# EasyEDA Pro project laterscreen.eprj, schematic Schematic1

## Sheets
1 mcu: Board Name: Board1; Create Date: 2025-05-13; Page Name: mcu; Project Name: laterscreen; Schematic Name: Schematic1; Update Date: 2025-05-16; Company: 嘉立创EDA; Page Size: A4; Version: V1.0
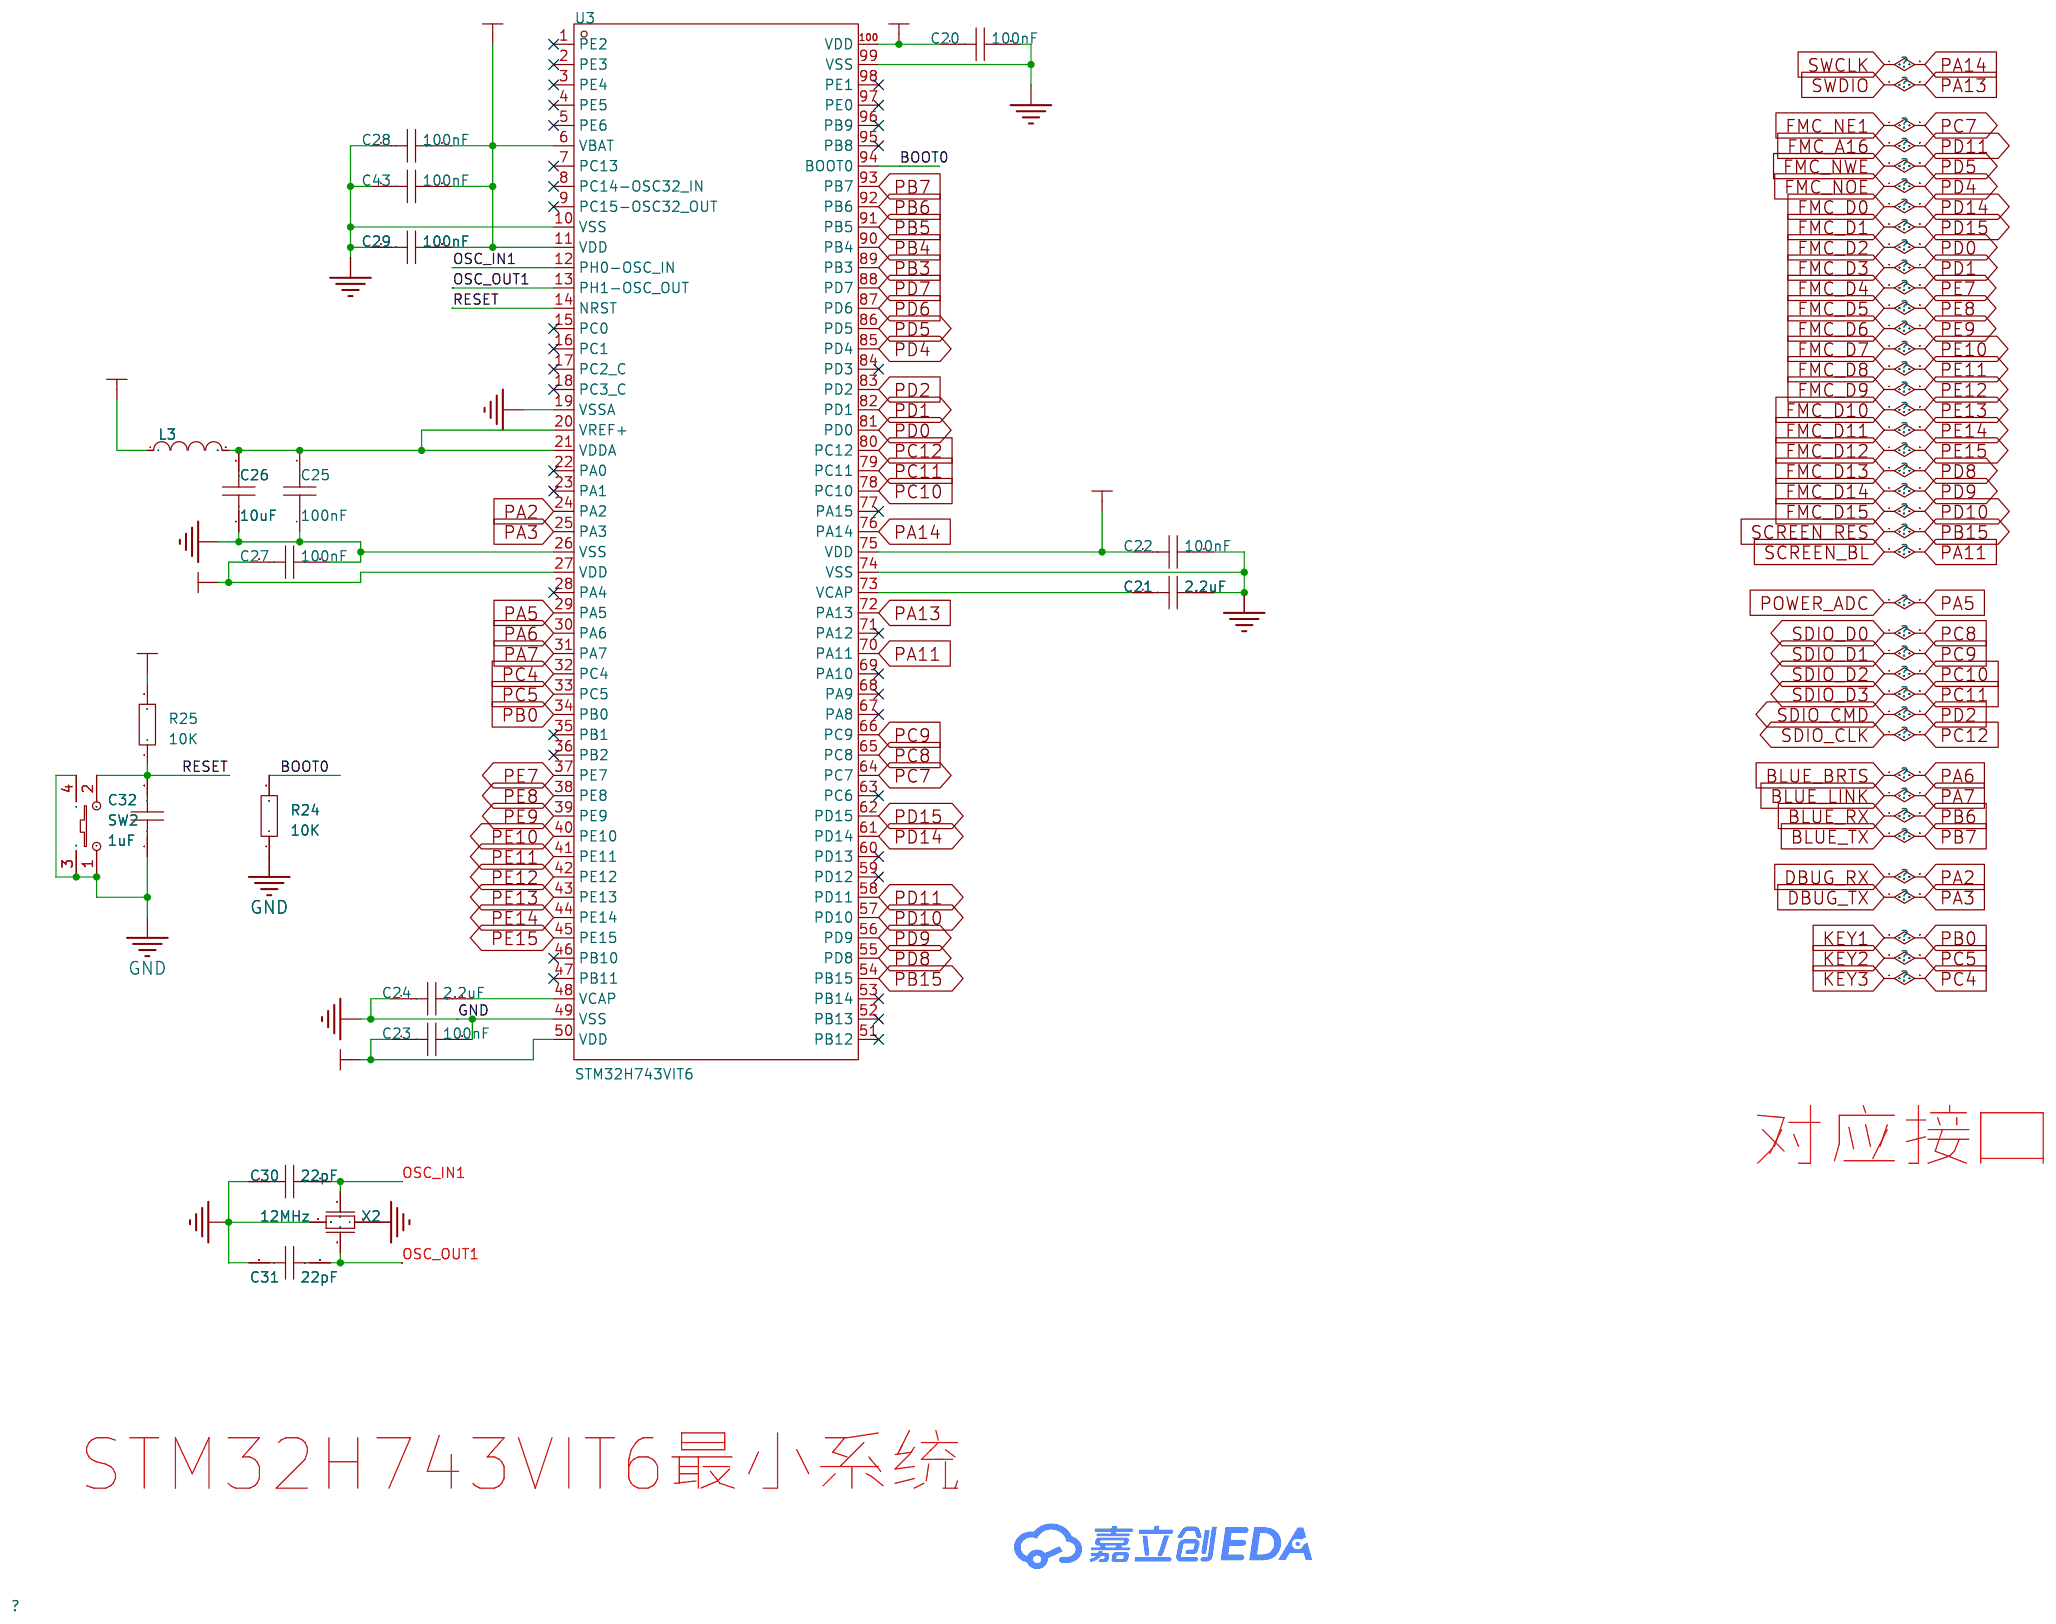
[diagram p0: mcu]
2 power: Page Name: power; Update Date: 2025-07-08
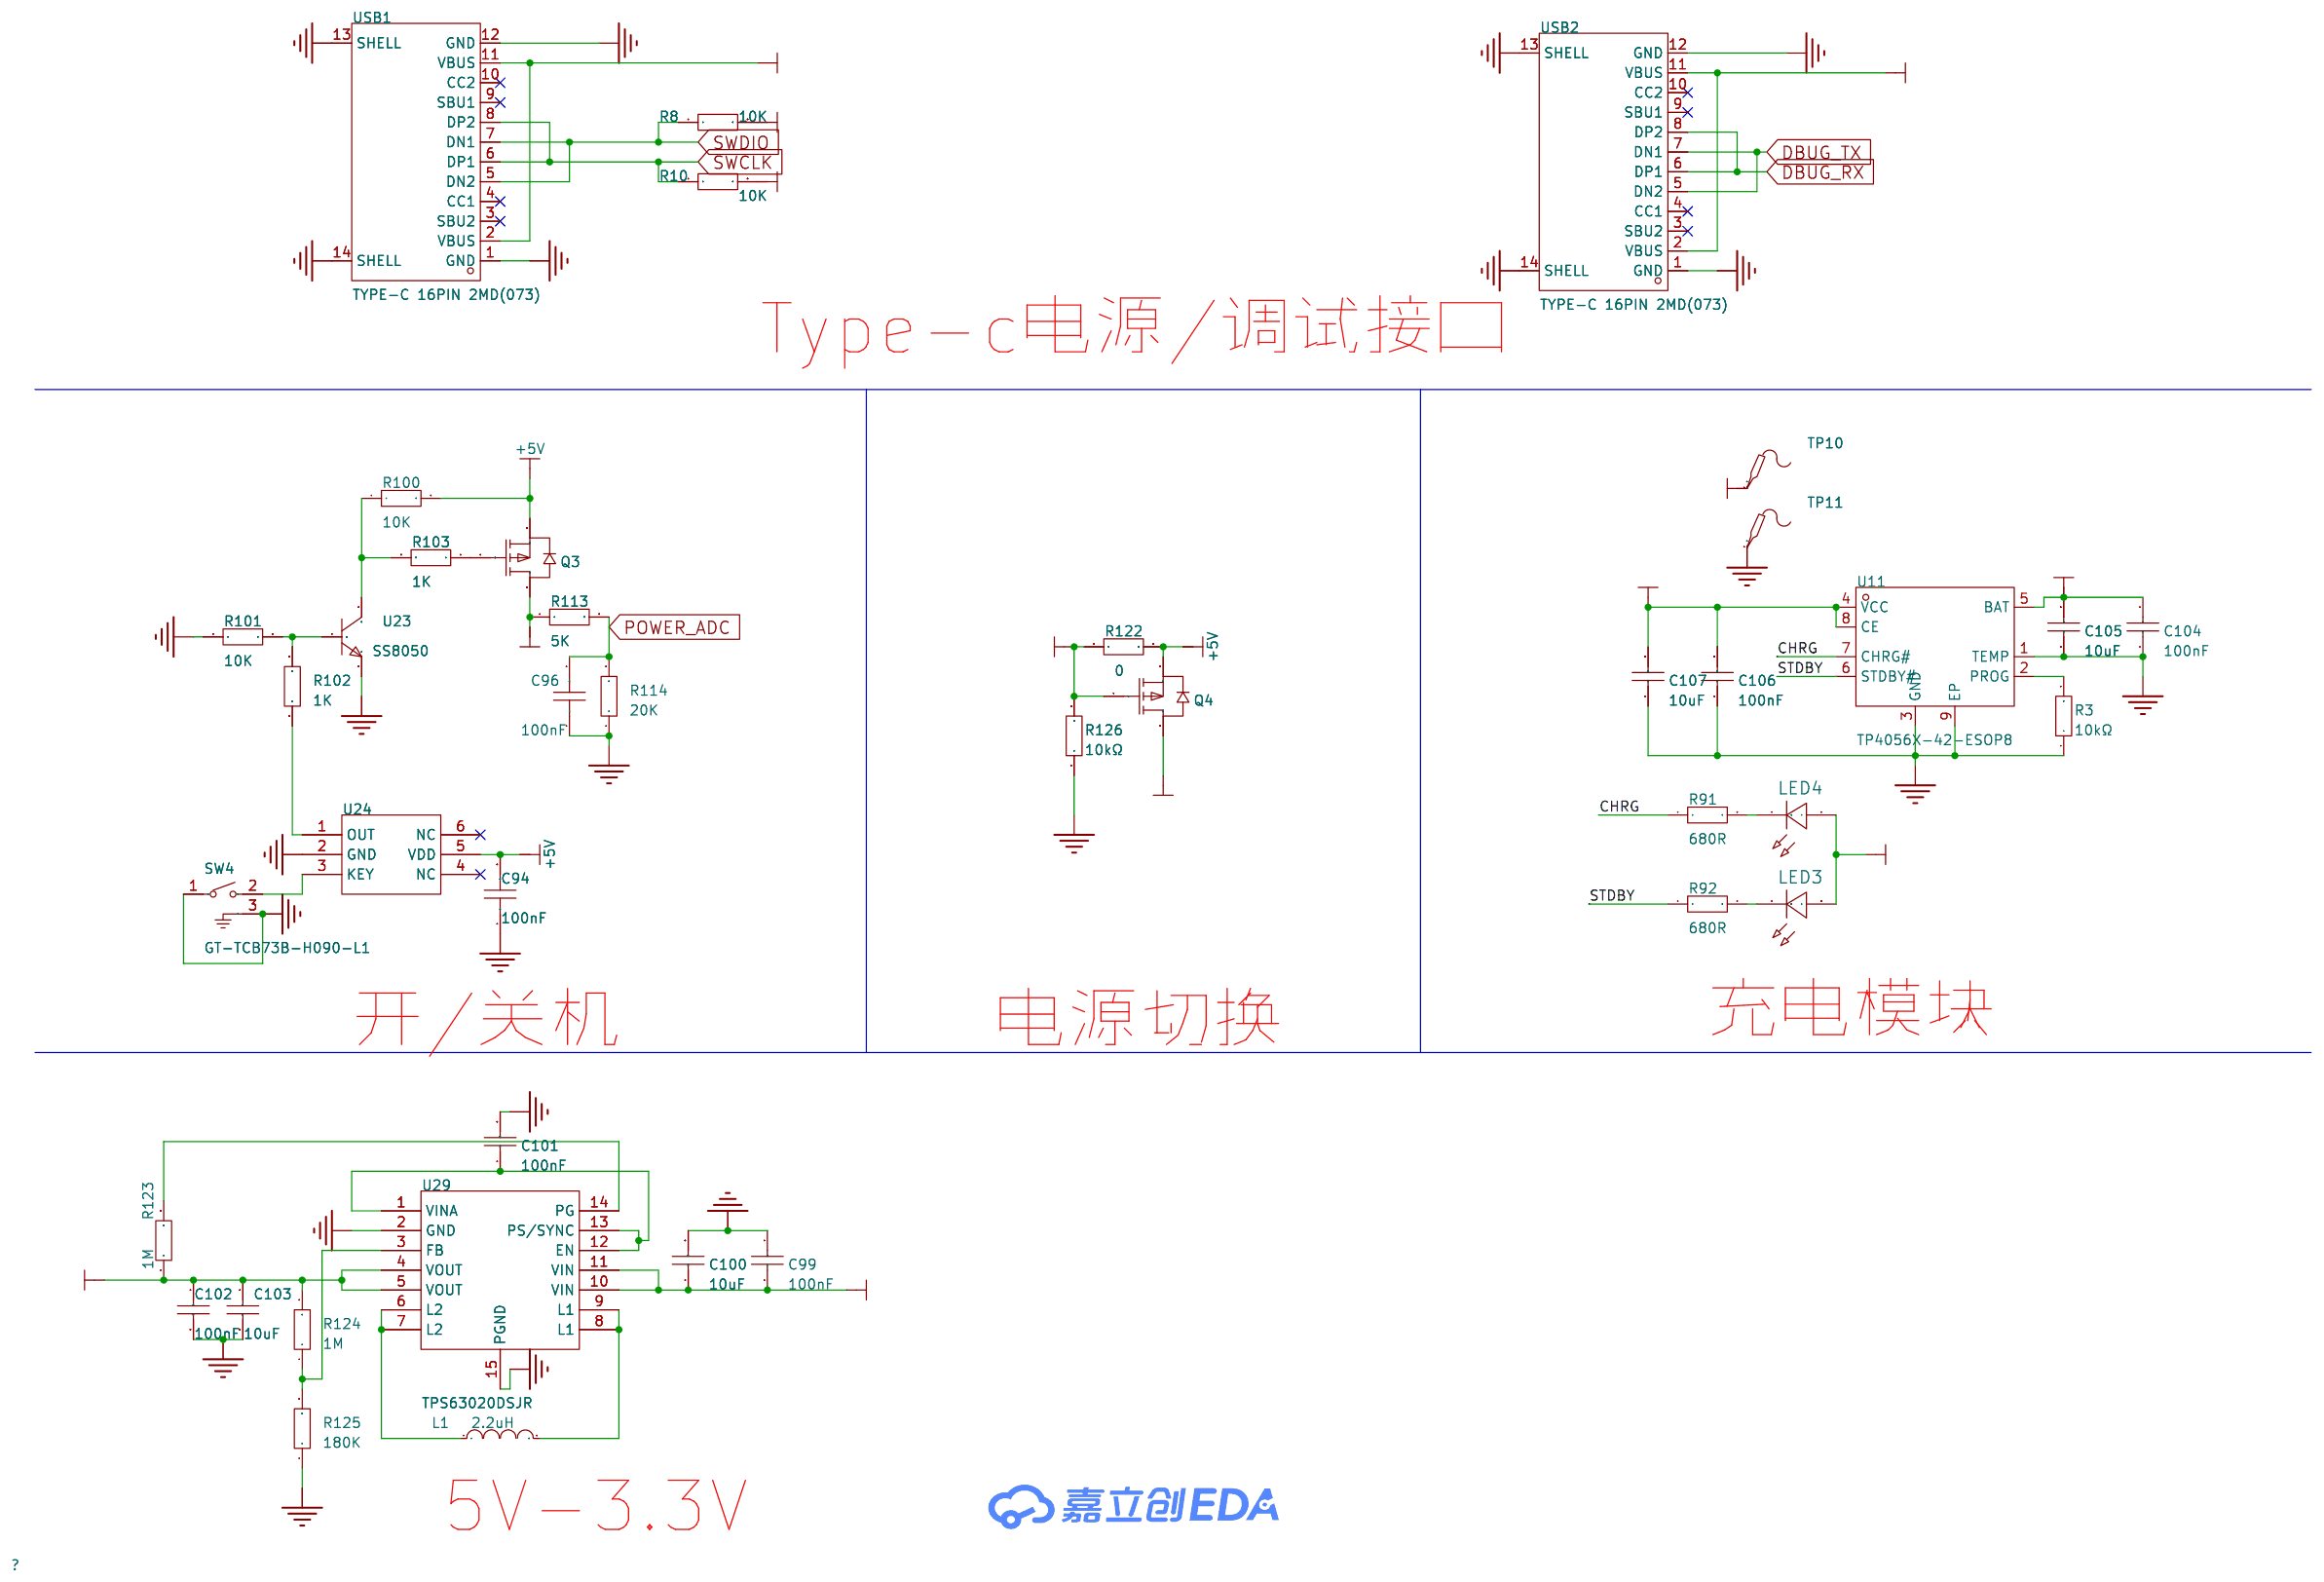
[diagram p1: power]
3 PERIPHERAL: Page Name: PERIPHERAL
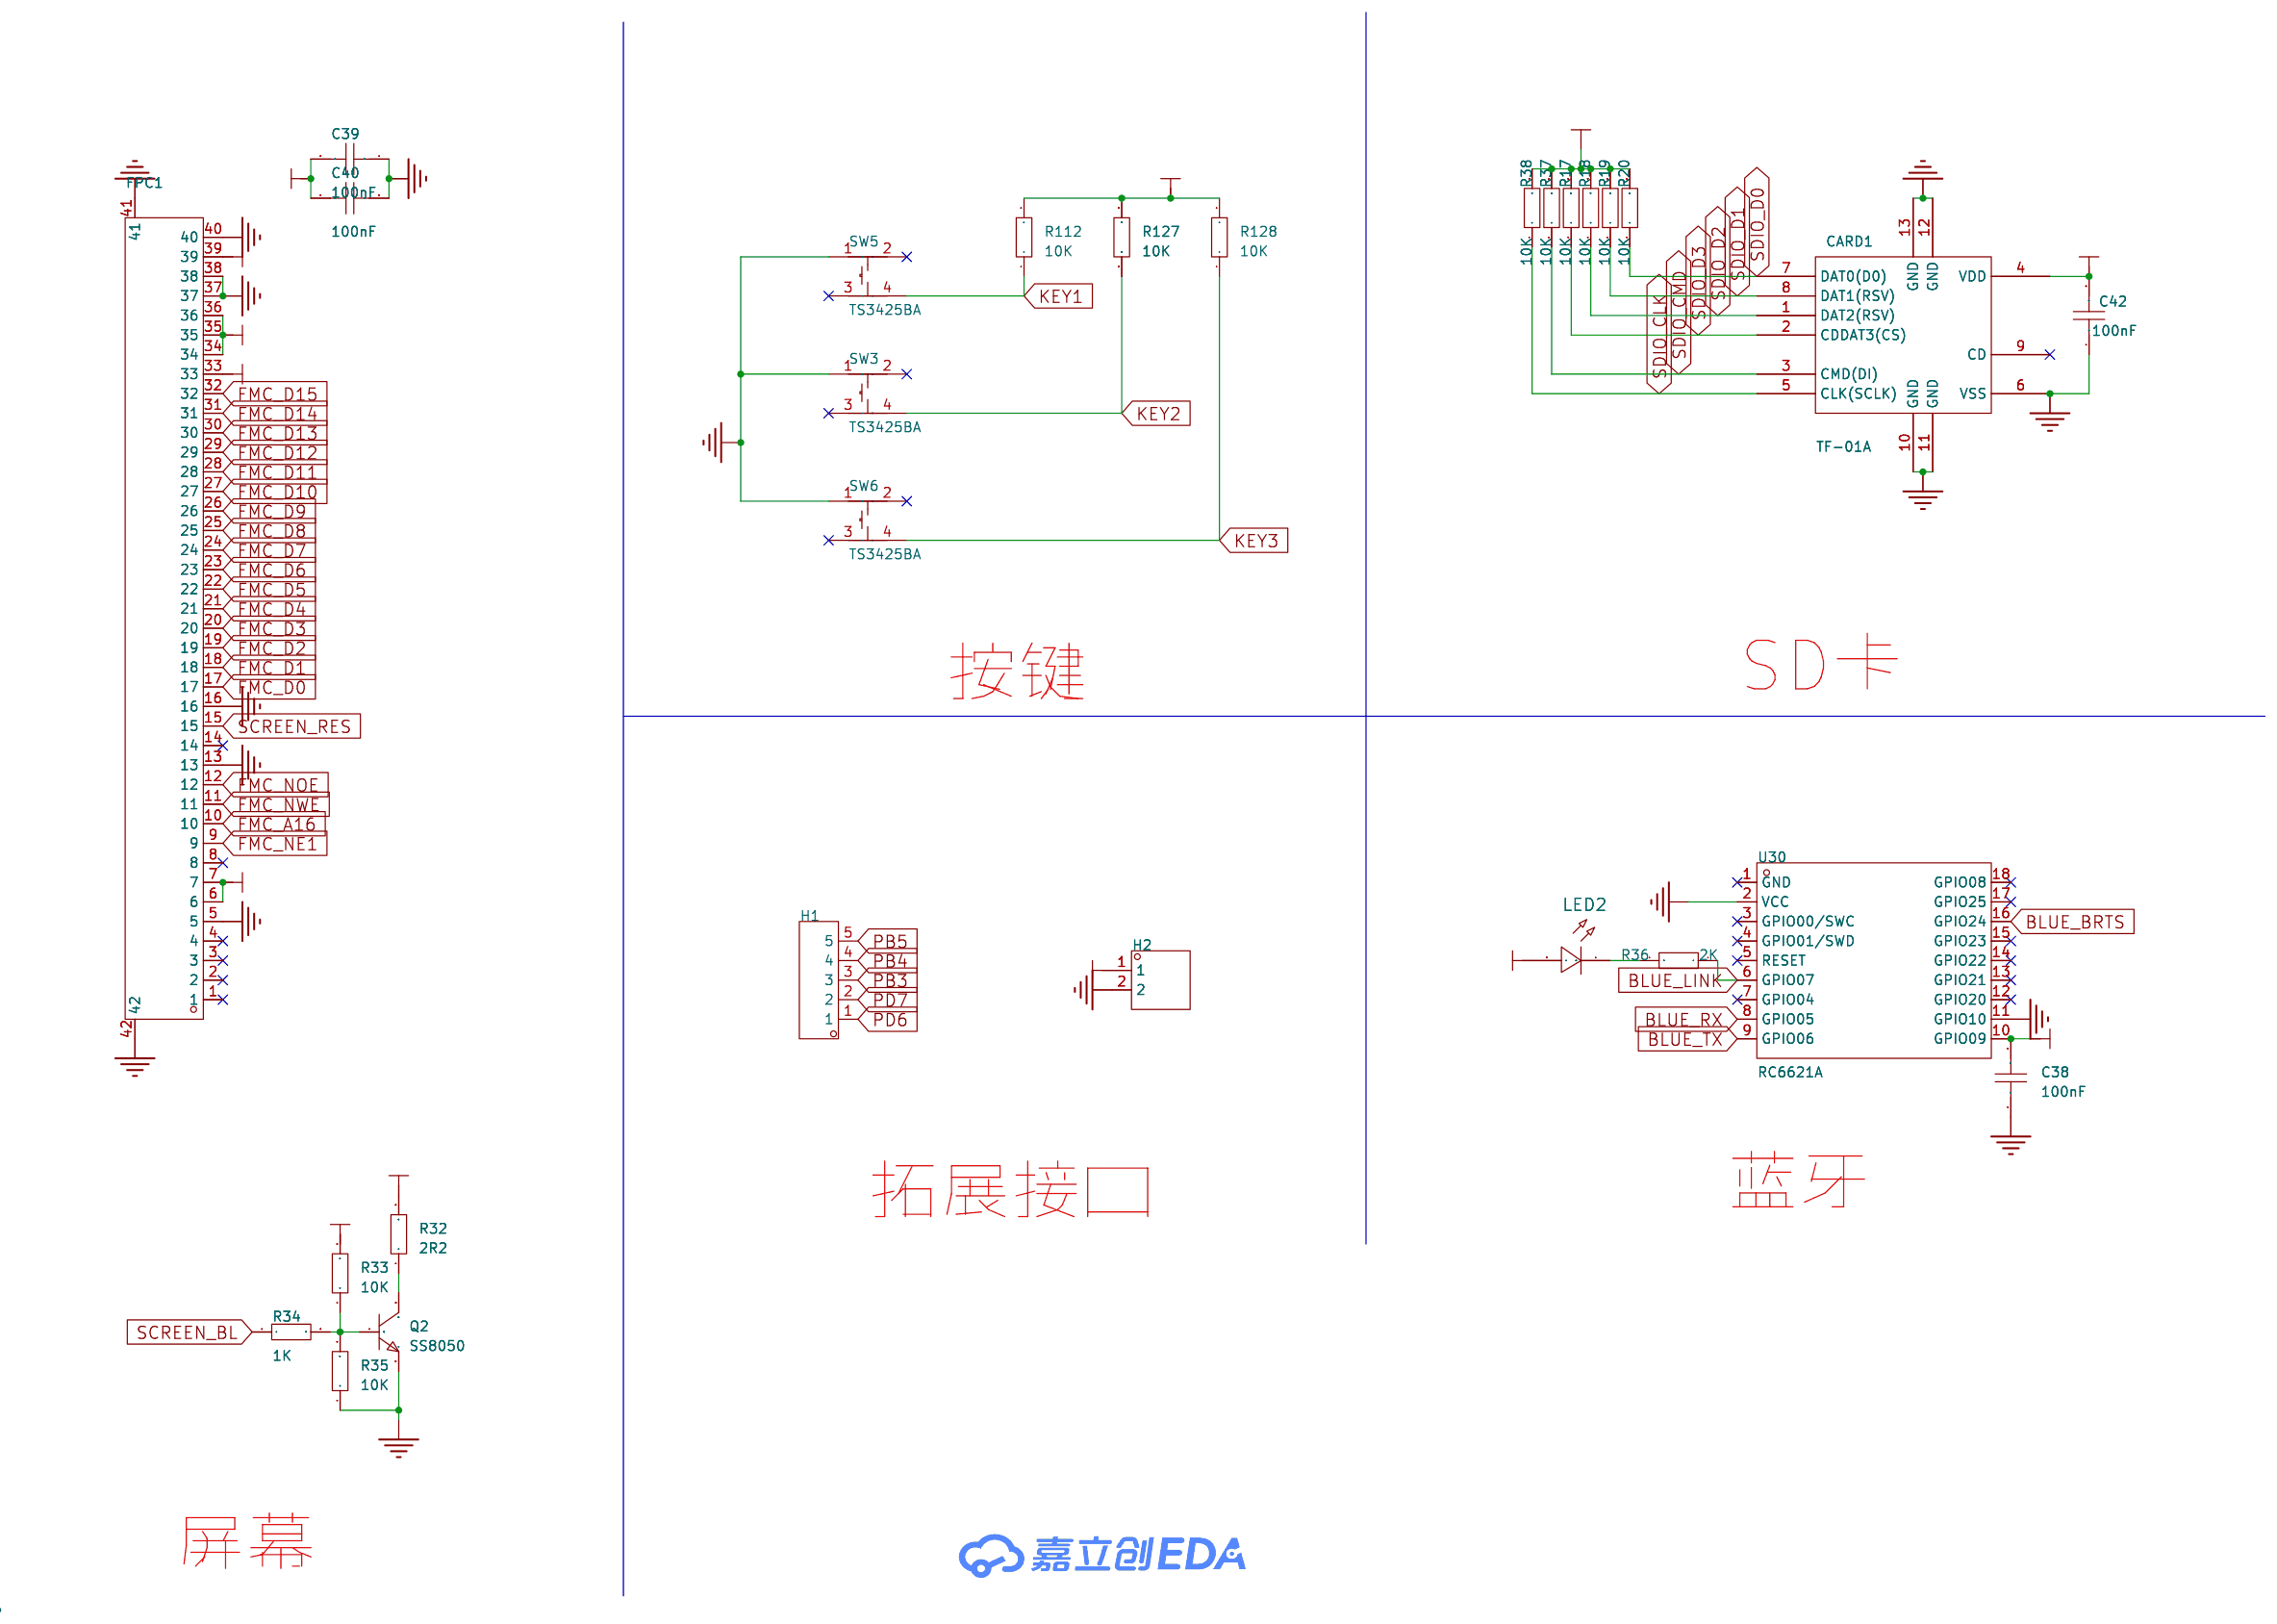
[diagram p2: PERIPHERAL]

## Parts
sheet mcu
C20  100nF  [C0603]
C21  2.2uF  [C0603]
C22  100nF  [C0603]
C23  100nF  [C0603]
C24  2.2uF  [C0603]
C25  100nF  [C0603]
C26  10uF  [C0603]
C27  100nF  [C0603]
C28  100nF  [C0603]
C29  100nF  [C0603]
C30  22pF  [C0603]
C31  22pF  [C0603]
C32  1uF  [C0603]
C43  100nF  [C0603]
L3  MPZ1608S181ATAH0  [L0603]
R24  10K  [R0603]
R25  10K  [R0603]
SW2  TS24CA 250gf 013  [SW-SMD_L4.7-W3.5-P3.35-EH]
U3  STM32H743VIT6  [LQFP-100_L14.0-W14.0-P0.50-LS16.0-BL]
X2  12MHz  [OSC-SMD_4P-L3.2-W2.5-BL]
sheet PERIPHERAL
C38  100nF  [C0603]
C39  100nF  [C0603]
C40  100nF  [C0603]
C42  100nF  [C0603]
CARD1  TF-01A  [TF-SMD_TF-01A]
FPC1  AFC07-S40ECA-00  [FPC-SMD_P0.50-40P_LCS-SJ-H2.0]
H1  -  [HDR-TH_5P-P2.54-V-M]
H2  -  [HDR-TH_2P-P2.54-V-M-1]
LED2  -  [LED_0603]
Q2  SS8050  [SOT-23-3_L2.9-W1.3-P1.90-LS2.4-BR]
R17  10K  [R0603]
R18  10K  [R0603]
R19  10K  [R0603]
R20  10K  [R0603]
R32  2R2  [R0603]
R33  10K  [R0603]
R34  1K  [R0603]
R35  10K  [R0603]
R36  2K  [R0603]
R37  10K  [R0603]
R38  10K  [R0603]
R112  10K  [R0603]
R127  10K  [R0603]
R128  10K  [R0603]
SW3  TS3425BA  [SW-SMD_4P-L4.2-W3.2-P2.15-LS4.6-1]
SW5  TS3425BA  [SW-SMD_4P-L4.2-W3.2-P2.15-LS4.6-1]
SW6  TS3425BA  [SW-SMD_4P-L4.2-W3.2-P2.15-LS4.6-1]
U30  RC6621A  [BULETM-SMD_18P-L15.2-W11.2-P1.27]
sheet power
C94  100nF  [C0603]
C96  100nF  [C0603]
C99  100nF  [C0603]
C100  10uF  [C0603]
C101  100nF  [C0603]
C102  100nF  [C0603]
C103  10uF  [C0603]
C104  100nF  [C0603]
C105  10uF  [C0603]
C106  100nF  [C0603]
C107  10uF  [C0603]
L1  2.2uH  [IND-SMD_L4.4-W4.2]
LED3  -  [LED_0603]
LED4  -  [LED_0603]
Q3  AO3401A  [SOT-23_L2.9-W1.3-P1.90-LS2.4-BR]
Q4  AO3401A  [SOT-23_L2.9-W1.3-P1.90-LS2.4-BR]
R3  10kΩ  [R0603]
R8  10K  [R0603]
R10  10K  [R0603]
R91  680R  [R0603]
R92  680R  [R0603]
R100  10K  [R0603]
R101  10K  [R0603]
R102  1K  [R0603]
R103  1K  [R0603]
R113  5K  [R0603]
R114  20K  [R0603]
R122  0  [R0603]
R123  1M  [R0603]
R124  1M  [R0603]
R125  180K  [R0603]
R126  10kΩ  [R0603]
SW4  GT-TCB73B-H090-L1  [SW-TH_G-SWITCH_GT-TCB73B-H090-L1]
TP10  -  [Test-Point-0.5mm]
TP11  -  [Test-Point-0.5mm]
U11  TP4056X-42-ESOP8  [SOP-8_L4.9-W3.9-P1.27-LS6.0-TL-EP]
U23  SS8050  [SOT-23-3_L2.9-W1.3-P1.90-LS2.4-BR]
U24  -  [SOT-23-6_L2.9-W1.6-P0.95-LS2.7-BR]
U29  TPS63020DSJR  [VSON-14_L4.0-W3.0-P0.50-BL-EP_TI_DSJ]
USB1  TYPE-C 16PIN 2MD(073)  [USB-C-SMD_TYPE-C-6PIN-2MD-073]
USB2  TYPE-C 16PIN 2MD(073)  [USB-C-SMD_TYPE-C-6PIN-2MD-073]

## Library data of the parts
C20-C32 C38-C40 C42 C43 C94 C96 = CAP_0603: Supplier Footprint: 0603
L3 = MPZ1608S181ATAH0: 标称阻抗@测试频率:180Ω@100MHz;误差:±25%;直流电阻(RDC):50mΩ;; LCSC Part Name: 单路 0603磁珠 阻抗180Ω@100MHz; Supplier Part: C275484; Manufacturer: TDK; Supplier Footprint: 0603; JLCPCB Part Class: 扩展库; Datasheet: https://atta.szlcsc.com/upload/public/pdf/source/20180928/C275484_34D1A8F6E9A7675BCEDD0742FE4F8E0F.pdf; Supplier: LCSC; Impedance @ Frequency: 180Ω@100MHz; Tolerance: ±25%; DC Resistance: 50mΩ; Current Rating: 2A; Circuits: 1
R8 R10 R17-R20 R24 R25 R32-R38 R91 R92 R100-R103 R112-R114 R122-R125 R127 R128 = Res_0603: Supplier Footprint: 0603
SW2 = TS24CA 250gf 013: 电路结构:单刀单掷;按钮形状:矩形按钮;作用力:250gf;安装方式:卧贴;开关长度:4.55mm;开关宽度:1.8mm;开关高度:3.5mm;带支架:不带;触点电流:50mA;额定电压(AC):-;额定电压(DC):12V;额定功率:0.6W;绝缘电阻:100MΩ;带灯:无;机械寿命:3万次;; LCSC Part Name: 2*4*3.5mm半包小贝贝TS-018小侧按键m165蓝牙耳机开关 250gf; Supplier Part: C5373430; Manufacturer: SHOU HAN(首韩); Supplier Footprint: SMD; JLCPCB Part Class: 扩展库; Datasheet: https://atta.szlcsc.com/upload/public/pdf/source/20230321/913029B0FB0CD391AF5EFD51697D8EC4.pdf; Supplier: LCSC; Circuit: 单刀单掷; Actuator Style: 矩形按钮; Operating Force: 250gf; Mounting Style: 卧贴; Switch Length: 4.55mm; Switch Width: 1.8mm; Switch Height: 3.5mm; Strike Gundam: 不带; Contact Current: 50mA; Voltage Rating (DC): 12V; Power Rating: 0.6W; Insulation Resistance: 100MΩ; Actuator/Cap Color: 黑色; With Lamp: 无; Mechanical Life: 3万次; Operating Temperature: -40℃~+85℃
U3 = STM32H743VIT6_C114409: CPU内核:ARM-M系列;程序存储容量:2MB;GPIO端口数量:82;工作电压范围:1.71V~3.6V;CPU最大主频:480MHz;; Supplier Part: C114409; Manufacturer: ST(意法半导体); Supplier Footprint: LQFP-100(14x14); JLCPCB Part Class: 扩展库; Datasheet: https://atta.szlcsc.com/upload/public/pdf/source/20200508/C529058_DA70143F266D6D825C3A912656F12A87.pdf; Supplier: LCSC; CPU Core: ARM-M系列; Program Storage Size: 2MB; GPIO Ports Number: 82; Operating Voltage Range: 1.71V~3.6V; CPU Maximum Speed: 480MHz; Operating Temperature Range: -40℃~+85℃; ADC (Bit): 16bit; DAC (Bit): 12bit; Universal Serial Bus: 有; Watchdog: 有; Infrared Data Association: 有; Low-Voltage Detect: 有; LCD Module: 有; Secure Digital Input and Output: 有; Direct Memory Access: 有; Internal Oscillator: 有
X2 = TAXM8M4RDBCCT2T: 频率:8MHz;频率公差:±10ppm;负载电容:10pF;; LCSC Part Name: 8MHz ±10ppm 10pF; Supplier Part: C400090; Manufacturer: TAE(雅晶鑫); Supplier Footprint: SMD3225-4P; JLCPCB Part Class: Extended Part; Datasheet: https://atta.szlcsc.com/upload/public/pdf/source/20190626/C400090_CF95B89E745AFE4EF2E392EF8AC009D6.pdf; Supplier: LCSC; Crystal Type: 贴片无源晶振; Frequency Tolerance: ±10ppm; Frequency Stability: ±15ppm; Load Capacitance: 10pF; Equivalent Series Resistance (ESR): 250Ω; Operating Temperature: -40℃~+85℃
CARD1 = TF-01A_C91145: 卡连接方式:自弹式;卡类型:MicroSD卡(TF卡);连接器类型:卡座;本体最大高度:1.85mm;工作温度范围:-;; LCSC Part Name: 自弹式 MicroSD卡(TF卡) 卡座; Supplier Part: C91145; Manufacturer: 韩国韩荣; Supplier Footprint: SMD; JLCPCB Part Class: 扩展库; Datasheet: https://atta.szlcsc.com/upload/public/pdf/source/20190322/C91145_63CBD6FB4639A3A3EC6A9721F18AE0FB.pdf; Supplier: LCSC; Card Connection Mode: 自弹式; Card Type: MicroSD卡(TF卡); Connector Type: 卡座; Supplementary Features: 带定位柱; Maximum Body Height: 1.85mm
FPC1 = AFC07-S40ECA-00: 锁定特性:抽屉式;触点类型:上接;触点数量:40P;间距:0.5mm;安装类型:卧贴;; LCSC Part Name: 间距:0.5mm P数:40P 抽屉式 上接; Supplier Part: C262648; Manufacturer: JS(钜硕电子); Supplier Footprint: SMD,P=0.5mm,卧贴; JLCPCB Part Class: 扩展库; Datasheet: https://atta.szlcsc.com/upload/public/pdf/source/20190726/C11082_A2E7B12387019CE4314BB5199EE0FDF4.pdf; Supplier: LCSC; Locking Feature: 抽屉式; Contact Type: 上接; Number of Contacts: 40P; Pitch: 0.5mm; Mounting Type: 卧贴; FFC, FCB Thickness: 0.3mm; Height Above Board: 2mm
H1 = HDR-M_2.54_1x5P: Supplier Part: C358687; Supplier Footprint: 插件
H2 = HDR-M_2.54_1x2P: Supplier Part: C124375; Supplier Footprint: 插件
LED2-LED4 = LED_0603-R: Supplier Footprint: 0603
Q2 = SS8050_C916392: 晶体管类型:NPN;集电极电流(Ic):1.5A;集射极击穿电压(Vceo):25V;功率(Pd):300mW;直流电流增益(hFE@Ic,Vce):-;; LCSC Part Name: NPN 电流:1.5A 耐压:25V; Supplier Part: C916392; Manufacturer: JSMSEMI(杰盛微); Supplier Footprint: SOT-23; JLCPCB Part Class: 扩展库; Datasheet: https://atta.szlcsc.com/upload/public/pdf/source/20230807/CAABCAAF77D43CB838E37CFA5C9BFE5C.pdf; Supplier: LCSC; Transistor Type: NPN; Collector Current (Ic): 1.5A; Collector-Emitter Breakdown Voltage (Vceo): 25V; Power Dissipation (Pd): 300mW; Collector Cut-Off Current (Icbo): 100nA; Collector-Emitter Saturation Voltage (VCE(sat)@Ic,Ib): 500mV@800mA,80mA; Operating Temperature: -55℃~+150℃
SW3 SW5 SW6 = TS3425BA: 电路结构:单刀单掷;按钮形状:椭圆形按钮;作用力:250gf;安装方式:立贴;开关长度:4.2mm;开关宽度:3.2mm;开关高度:2.5mm;带支架:不带;触点电流:50mA;额定电压(DC):12V;绝缘电阻:100MΩ;机械寿命:10万次;; LCSC Part Name: 4.2*3.2*2.5mm 立贴 轻触开关; Supplier Part: C2681476; Manufacturer: SHOU HAN(首韩); Supplier Footprint: SMD; JLCPCB Part Class: 扩展库; Datasheet: https://atta.szlcsc.com/upload/public/pdf/source/20210107/C2681476_BF217B2301F0070AA49504CB0BFDE895.pdf; Supplier: LCSC; Circuit: 单刀单掷; Actuator Style: 椭圆形按钮; Operating Force: 250gf; Mounting Style: 立贴; Switch Length: 4.2mm; Switch Width: 3.2mm; Switch Height: 2.5mm; Strike Gundam: 不带; Contact Current: 50mA; Voltage Rating (DC): 12V; Insulation Resistance: 100MΩ; Actuator/Cap Color: 白色; Pin Style: J型引脚; Mechanical Life: 10万次; Operating Temperature: -20℃~+85℃
U30 = RC6621A: 核心芯片:HS6621A芯片;支持接口:UART;最大发射功率:6dBm;通讯距离:20m~100m;接收灵敏度:-94dBm;; LCSC Part Name: 蓝牙5.2 BLE透传模块; Supplier Part: C2886280; Manufacturer: RF Crazy(智汉); Supplier Footprint: SMD,11x15mm; JLCPCB Part Class: 扩展库; Datasheet: https://atta.szlcsc.com/upload/public/pdf/source/20230407/49E21971C810D795DE5D434EE457DEDA.pdf; Supplier: LCSC; Core  IC: HS6621A芯片; Support Interface: UART; Output Power  (Max): 6dBm; Operating Voltage: 2V~3.6V; Receive  Current: 3.8mA; Send  Current: 8mA; Communication Distance: 20m~100m; Sensitivity: -94dBm; Operating Temperature: -30℃~+85℃
C99 C101 C102 C104 C106 = CC0603KRX7R9BB104: 容值:100nF;精度:±10%;额定电压:50V;材质(温度系数):X7R;; LCSC Part Name: 100nF ±10% 50V; Supplier Part: C14663; Manufacturer: YAGEO(国巨); Supplier Footprint: 0603; JLCPCB Part Class: Basic Part; Datasheet: https://atta.szlcsc.com/upload/public/pdf/source/20180910/C282072_33301C7F631E79921B82A8DAC6BCC5B3.pdf; Supplier: LCSC; Tolerance: ±10%; Voltage Rated: 50V; Temperature Coefficient: X7R
C100 C103 C105 C107 = CL10A106MA8NRNC: 容值:10uF;精度:±20%;额定电压:25V;材质(温度系数):X5R;; LCSC Part Name: 10uF ±20% 25V; Supplier Part: C96446; Manufacturer: SAMSUNG(三星); Supplier Footprint: 0603; JLCPCB Part Class: 基础库; Datasheet: https://atta.szlcsc.com/upload/public/pdf/source/20170325/1490427913016.pdf; Supplier: LCSC; Tolerance: ±20%; Voltage Rated: 25V; Temperature Coefficient: X5R
L1 = FXL0420-4R7-M: 电感值:4.7uH;精度:±20%;额定电流:2.8A;饱和电流(Isat):3A;类型:一体成型电感;; LCSC Part Name: 4.7uH ±20% 3A; Supplier Part: C167208; Manufacturer: cjiang(长江微电); Supplier Footprint: SMD,4.2x4.4mm; JLCPCB Part Class: 扩展库; Datasheet: https://atta.szlcsc.com/upload/public/pdf/source/20240426/3189EA8206330E2108542F9E34E540E7.pdf; Supplier: LCSC; Tolerance: ±20%; Rated Current: 2.8A; Saturation Current (Isat): 3A; DC Resistance (DCR): 105mΩ; Type: 一体成型电感
Q3 Q4 = AO3401A_C15127: 类型:P沟道;漏源电压(Vdss):30V;连续漏极电流(Id):4A;功率(Pd):1.4W;导通电阻(RDS(on)@Vgs,Id):44mΩ@10V,4.3A;; LCSC Part Name: P沟道30V4A; Supplier Part: C15127; Manufacturer: AOS; Supplier Footprint: SOT-23-3L; JLCPCB Part Class: BasicPart; Datasheet: https://atta.szlcsc.com/upload/public/pdf/source/20160507/1462613609053.pdf; Supplier: LCSC; Type: P沟道; Drain Source Voltage (Vdss): 30V; Continuous Drain Current (Id): 4A; Power Dissipation (Pd): 1.4W; Drain Source On Resistance (RDS(on)@Vgs,Id): 44mΩ@10V,4.3A; Gate Threshold Voltage (Vgs(th)@Id): 1.3V@250uA
R3 R126 = 0603WAF1002T5E: 电阻类型:厚膜电阻;阻值:10kΩ;精度:±1%;功率:100mW;; LCSC Part Name: 厚膜电阻 10kΩ ±1% 100mW; Supplier Part: C25804; Manufacturer: UNI-ROYAL(厚声); Supplier Footprint: 0603; JLCPCB Part Class: 基础库; Datasheet: https://atta.szlcsc.com/upload/public/pdf/source/20200306/C422600_1E6D84923E4A46A82E41ADD87F860B5C.pdf; Supplier: LCSC; Type: 厚膜电阻; Tolerance: ±1%; Power(Watts): 100mW; Temperature Coefficient: ±100ppm/℃; Overload Voltage (Max): 75V; Operating Temperature Range: -55℃~+155℃
SW4 = GT-TCB73B-H090-L1: 电路结构:单刀单掷;按钮形状:圆形按钮;作用力:2.5N;安装方式:卧插;开关长度:4.5mm;开关宽度:4.5mm;开关高度:9mm;带支架:不带;触点电流:50mA;额定电压(DC):12V;绝缘电阻:100MΩ;带灯:无;机械寿命:10万次;; LCSC Part Name: 4.5*4.5*9mm 卧插 轻触开关; Supplier Part: C2890355; Manufacturer: G-Switch(品赞); Supplier Footprint: 插件; JLCPCB Part Class: 扩展库; Datasheet: https://atta.szlcsc.com/upload/public/pdf/source/20211129/A9DBC36F7854845B7C58D6A3B2089FE3.pdf; Supplier: LCSC; Circuit: 单刀单掷; Actuator Style: 圆形按钮; Operating Force: 2.5N; Mounting Style: 卧插; Switch Length: 4.5mm; Switch Width: 4.5mm; Switch Height: 9mm; Strike Gundam: 不带; Contact Current: 50mA; Voltage Rating (DC): 12V; Insulation Resistance: 100MΩ; Actuator/Cap Color: 黑色; With Lamp: 无; Pin Style: PC引脚; Mechanical Life: 10万次; Operating Temperature: -30℃~+85℃
TP10 TP11 = Test-Point: Test Point 测试点
U11 = TP4056X-42-ESOP8: Supplier Part: C2763448; Manufacturer: TOPPOWER(南京拓微); Supplier Footprint: SOP-8-EP-150mil; JLCPCB Part Class: 扩展库; Datasheet: https://atta.szlcsc.com/upload/public/pdf/source/20221111/3D7D53D5011BF4ED4C4D0D9BFDBB1404.pdf; Supplier: LCSC
U23 = SS8050_C7420370: 晶体管类型:NPN;集电极电流(Ic):1.5A;集射极击穿电压(Vceo):25V;功率(Pd):300mW;直流电流增益(hFE@Ic,Vce):120@100mA,1.0V;; LCSC Part Name: 耐压:25V 电流:1.5A NPN H档 200-350; Supplier Part: C7420370; Manufacturer: 宏迦橙; Supplier Footprint: SOT-23; JLCPCB Part Class: Extended Part; Datasheet: https://atta.szlcsc.com/upload/public/pdf/source/20231222/9C4050A7669EB24B3ACD0418218817FD.pdf; Supplier: LCSC; Transistor Type: NPN; Collector Current (Ic): 1.5A; Collector-Emitter Breakdown Voltage (Vceo): 25V; Power Dissipation (Pd): 300mW; DC Current Gain (hFE@Ic,Vce): 120@100mA,1.0V; Transition Frequency (fT): 100MHz; Collector Cut-Off Current (Icbo): 100nA; Collector-Emitter Saturation Voltage (VCE(sat)@Ic,Ib): 500mV@800mA,80mA; Operating Temperature: -55℃~+150℃
U24 = EC190708
U29 = TPS63020DSJR: 功能类型:升降压型;输出类型:可调;输入电压:1.8V~5.5V;输出电压:1.2V~5.5V;输出电流(最大值):3.5A;; Supplier Part: C15483; Manufacturer: TI(德州仪器); Supplier Footprint: VSON-14-EP(3x4); JLCPCB Part Class: 扩展库; Datasheet: https://www.ti.com/cn/lit/gpn/tps63020; Supplier: LCSC; Function: 升降压型; Output Type: 可调; Input Voltage: 1.8V~5.5V; Output Voltage: 1.2V~5.5V; Output Current (Max): 3.5A; Switching Frequency: 2.4MHz; Operating Temperature: -40℃~+85℃@(TA); Synchronous Rectification: 是; Number of Outputs: 1; Topology: 降压-升压式; Switch tube (built-in/external): 内置
USB1 USB2 = TYPE-C 16PIN 2MD(073): 连接器类型:Type-C;标准:USB 3.1;公母:母;安装方式:卧贴;触点数量:16P;端口数量:1;额定电流 - 电源:5A;工作温度范围:-25℃~+85℃;; LCSC Part Name: Type-C 母 卧贴; Supplier Part: C2765186; Manufacturer: SHOU HAN(首韩); Supplier Footprint: SMD; JLCPCB Part Class: 扩展库; Datasheet: https://atta.szlcsc.com/upload/public/pdf/source/20211123/39B17C16241EAC15C5E277BDA434118E.pdf; Supplier: LCSC; Connector Type: Type-C; Standard: USB 3.1; Gender: 母; Mounting Style: 卧贴; Number of Contacts: 16P; Number of Ports: 1; Current Rating - Power (Max): 5A; Operating Temperature Range: -25℃~+85℃; Rated Voltage (Max): 5V; Connect-Disconnect Life: 5千次; Core Colour: 黑色

## Nets
5V: C99.1 C100.1 Q3.3(D) R113.1 U29.10(VIN) U29.11(VIN)
+5V: C94.2 Q3.2(S) Q4.2(S) R100.2 R122.2 U24.5(VDD)
GND: C20.2 C21.2 C22.2 C23.2 C24.1 C25.1 C26.1 C27.2 C28.1 C29.1 C30.1 C31.1 C32.1 C38.1 C39.1 C40.2 C42.1 C43.1 C94.1 C96.1 C99.2 C100.2 C101.2 C102.2 C103.2 C104.1 C105.1 C106.1 C107.1 CARD1.6(VSS) CARD1.10(GND) CARD1.11(GND) CARD1.12(GND) CARD1.13(GND) FPC1.5 FPC1.13 FPC1.16 FPC1.37 FPC1.38 FPC1.40 FPC1.41 FPC1.42 H2.2 Q2.2(E) R3.1 R24.1 R35.1 R101.1 R114.1 R125.1 R126.1 SW2.1 SW2.3 SW2.4 SW3.1 SW4.1 SW4.3 SW5.1 SW6.1 TP11.1 U3.10(VSS) U3.19(VSSA) U3.26(VSS) U3.49(VSS) U3.74(VSS) U3.99(VSS) U11.1(TEMP) U11.3(GND) U11.9(EP) U23.2(E) U24.2(GND) U29.2(GND) U29.15(PGND) U30.2(VCC) U30.11(GPIO10) USB1.1(GND) USB1.12(GND) USB1.13(SHELL) USB1.14(SHELL) USB2.1(GND) USB2.12(GND) USB2.13(SHELL) USB2.14(SHELL) X2.2 X2.4
VBAT: C104.2 C105.2 Q4.3(D) TP10.1 U11.5(BAT)
VBUS: C106.2 C107.2 LED3.2(A) LED4.2(A) Q4.1(G) R122.1 R126.2 U11.4(VCC) U11.8(CE) USB1.2(VBUS) USB1.11(VBUS) USB2.2(VBUS) USB2.11(VBUS)
VCC3V3: C20.1 C22.1 C23.1 C27.1 C28.2 C29.2 C38.2 C39.2 C40.1 C42.2 C43.2 C102.1 C103.1 CARD1.4(VDD) FPC1.6 FPC1.7 FPC1.33 FPC1.39 H2.1 L3.1 LED2.2(A) R8.2 R10.2 R17.2 R18.2 R19.2 R20.2 R25.2 R33.2 R37.2 R38.2 R112.2 R123.1 R124.2 R127.2 R128.2 U3.6(VBAT) U3.11(VDD) U3.27(VDD) U3.50(VDD) U3.75(VDD) U3.100(VDD) U29.4(VOUT) U29.5(VOUT) U30.10(GPIO09)
BLUE_BRTS: U3.30(PA6) U30.16(GPIO24)
BLUE_LINK: R36.1 U3.31(PA7) U30.6(GPIO07)
BLUE_RX: U3.92(PB6) U30.8(GPIO05)
BLUE_TX: U3.93(PB7) U30.9(GPIO06)
BOOT0: R24.2 U3.94(BOOT0)
CHRG: R91.1 U11.7(CHRG#)
DBUG_RX: U3.24(PA2) USB2.6(DP1) USB2.8(DP2)
DBUG_TX: U3.25(PA3) USB2.5(DN2) USB2.7(DN1)
FMC_A16: FPC1.10 U3.58(PD11)
FMC_D0: FPC1.17 U3.61(PD14)
FMC_D1: FPC1.18 U3.62(PD15)
FMC_D2: FPC1.19 U3.81(PD0)
FMC_D3: FPC1.20 U3.82(PD1)
FMC_D4: FPC1.21 U3.37(PE7)
FMC_D5: FPC1.22 U3.38(PE8)
FMC_D6: FPC1.23 U3.39(PE9)
FMC_D7: FPC1.24 U3.40(PE10)
FMC_D8: FPC1.25 U3.41(PE11)
FMC_D9: FPC1.26 U3.42(PE12)
FMC_D10: FPC1.27 U3.43(PE13)
FMC_D11: FPC1.28 U3.44(PE14)
FMC_D12: FPC1.29 U3.45(PE15)
FMC_D13: FPC1.30 U3.55(PD8)
FMC_D14: FPC1.31 U3.56(PD9)
FMC_D15: FPC1.32 U3.57(PD10)
FMC_NE1: FPC1.9 U3.64(PC7)
FMC_NOE: FPC1.12 U3.85(PD4)
FMC_NWE: FPC1.11 U3.86(PD5)
K: FPC1.34 FPC1.35 FPC1.36 R32.2
KEY1: R112.1 SW5.4 U3.34(PB0)
KEY2: R127.1 SW3.4 U3.33(PC5)
KEY3: R128.1 SW6.4 U3.32(PC4)
OSC_IN1: C30.2 U3.12(PH0-OSC_IN) X2.1
OSC_OUT1: C31.2 U3.13(PH1-OSC_OUT) X2.3
PA5: C96.2 R113.2 R114.2 U3.29(PA5)
PA11: R34.1 U3.70(PA11)
PA13: R8.1 U3.72(PA13) USB1.5(DN2) USB1.7(DN1)
PA14: R10.1 U3.76(PA14) USB1.6(DP1) USB1.8(DP2)
PB3: H1.3 U3.89(PB3)
PB4: H1.4 U3.90(PB4)
PB5: H1.5 U3.91(PB5)
PB15: FPC1.15 U3.54(PB15)
PC8: CARD1.7(DAT0(D0)) R20.1 U3.65(PC8)
PC9: CARD1.8(DAT1(RSV)) R19.1 U3.66(PC9)
PC10: CARD1.1(DAT2(RSV)) R18.1 U3.78(PC10)
PC11: CARD1.2(CDDAT3(CS)) R17.1 U3.79(PC11)
PC12: CARD1.5(CLK(SCLK)) R38.1 U3.80(PC12)
PD2: CARD1.3(CMD(DI)) R37.1 U3.83(PD2)
PD6: H1.1 U3.87(PD6)
PD7: H1.2 U3.88(PD7)
RESET: C32.2 R25.1 SW2.2 U3.14(NRST)
STDBY: R92.1 U11.6(STDBY#)
$1N1164: C21.1 U3.73(VCAP)
$1N1165: C24.2 U3.48(VCAP)
$1N1173: C25.2 C26.2 L3.2 U3.20(VREF+) U3.21(VDDA)
$2N523: C101.1 U29.1(VINA) U29.12(EN) U29.13(PS/SYNC)
$2N525: R123.2 U29.14(PG)
$2N529: R124.1 R125.2 U29.3(FB)
$2N530: L1.2 U29.8(L1) U29.9(L1)
$2N531: L1.1 U29.6(L2) U29.7(L2)
$2N1598: R3.2 U11.2(PROG)
$2N1608: R102.1 U24.1(OUT)
$2N1610: R101.2 R102.2 U23.1(B)
$2N1611: R100.1 R103.2 U23.3(C)
$2N1616: Q3.1(G) R103.1
$2N1625: LED4.1(C) R91.2
$2N1628: LED3.1(C) R92.2
$2N1632: SW4.2 U24.3(KEY)
$3N1366: LED2.1(C) R36.2
$3N2101: Q2.3(C) R32.1
$3N2103: Q2.1(B) R33.1 R34.2 R35.2

Not connected (* = marked no-connect by the designer): CARD1 9(CD)*; FPC1 1* 2* 3* 4* 8* 14*; SW3 2* 3*; SW5 2* 3*; SW6 2* 3*; U3 1(PE2)* 2(PE3)* 3(PE4)* 4(PE5)* 5(PE6)* 7(PC13)* 8(PC14-OSC32_IN)* 9(PC15-OSC32_OUT)* 15(PC0)* 16(PC1)* 17(PC2_C)* 18(PC3_C)* 22(PA0)* 23(PA1)* 28(PA4)* 35(PB1)* 36(PB2)* 46(PB10)* 47(PB11)* 51(PB12)* 52(PB13)* 53(PB14)* 59(PD12)* 60(PD13)* 63(PC6)* 67(PA8)* 68(PA9)* 69(PA10)* 71(PA12)* 77(PA15)* 84(PD3)* 95(PB8)* 96(PB9)* 97(PE0)* 98(PE1)*; U24 4(NC)* 6(NC)*; U30 1(GND)* 3(GPIO00/SWC)* 4(GPIO01/SWD)* 5(RESET)* 7(GPIO04)* 12(GPIO20)* 13(GPIO21)* 14(GPIO22)* 15(GPIO23)* 17(GPIO25)* 18(GPIO08)*; USB1 3(SBU2)* 4(CC1)* 9(SBU1)* 10(CC2)*; USB2 3(SBU2)* 4(CC1)* 9(SBU1)* 10(CC2)*

## Notes on the sheets
sheet 1
- 对应接口
- STM32H743VIT6最小系统
sheet 2
- Type-c电源/调试接口
- 开/关机
- 电源切换
- 充电模块
- 5V-3.3V
sheet 3
- 按键
- SD卡
- 拓展接口
- 蓝牙
- 屏幕
